# Altium schematic sheet Schematic.SchDoc
size 297 x 209 mm
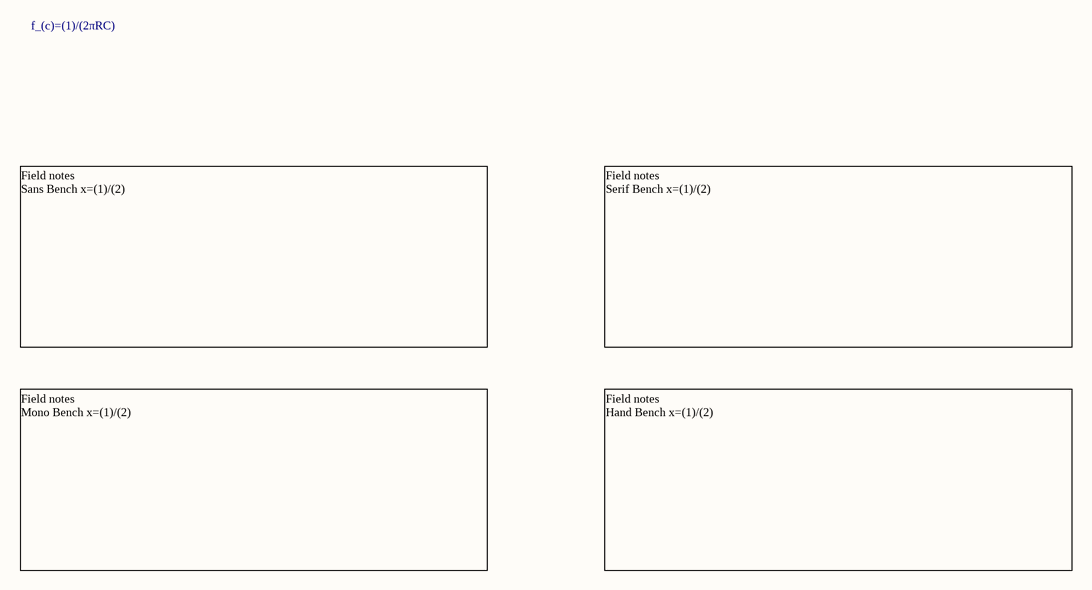
[diagram p0: Schematic.SchDoc]

## Notes on the sheet
- f_(c)=(1)/(2πRC)
- Field notes
  Sans Bench x=(1)/(2)
- Field notes
  Serif Bench x=(1)/(2)
- Field notes
  Mono Bench x=(1)/(2)
- Field notes
  Hand Bench x=(1)/(2)